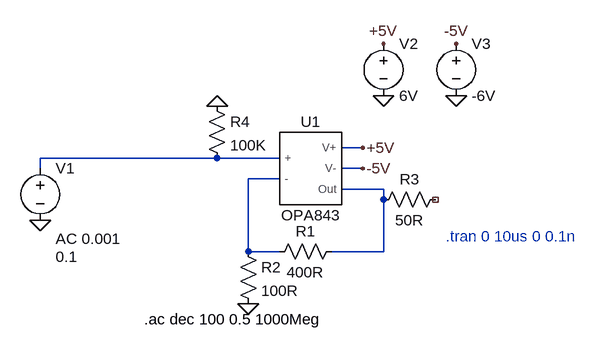
[diagram p0: schematic Draft1.asc]
Draft1.asc, the LTspice schematic file:
Version 4.1
SHEET 1 880 680
WIRE 256 160 224 160
WIRE 32 176 -240 176
WIRE 128 176 32 176
WIRE -240 192 -240 176
WIRE 256 192 224 192
WIRE 128 208 80 208
WIRE 288 224 224 224
WIRE 288 240 288 224
WIRE 80 320 80 208
WIRE 128 320 80 320
WIRE 288 320 288 240
WIRE 288 320 208 320
FLAG 80 400 0
FLAG -240 272 0
FLAG 400 80 0
FLAG 288 80 0
FLAG 288 0 +5V
FLAG 400 0 -5V
FLAG 256 160 +5V
FLAG 256 192 -5V
FLAG 32 96 0
SYMBOL OPA843 176 192 R0
SYMATTR InstName U1
SYMBOL res 224 304 R90
WINDOW 0 0 56 VBottom 2
WINDOW 3 32 56 VTop 2
SYMATTR InstName R1
SYMATTR Value 400R
SYMBOL res 64 304 R0
SYMATTR InstName R2
SYMATTR Value 100R
SYMBOL voltage -240 176 R0
WINDOW 3 24 152 Left 2
WINDOW 123 24 124 Left 2
WINDOW 39 0 0 Left 0
SYMATTR InstName V1
SYMATTR Value 0.1
SYMATTR Value2 AC 0.001
SYMBOL voltage 288 -16 R0
WINDOW 123 0 0 Left 0
WINDOW 39 0 0 Left 0
SYMATTR InstName V2
SYMATTR Value 6V
SYMBOL voltage 400 -16 R0
WINDOW 123 0 0 Left 0
WINDOW 39 0 0 Left 0
SYMATTR InstName V3
SYMATTR Value -6V
SYMBOL res 384 224 R90
WINDOW 0 0 56 VBottom 2
WINDOW 3 32 56 VTop 2
SYMATTR InstName R3
SYMATTR Value 50R
SYMBOL res 16 80 R0
SYMATTR InstName R4
SYMATTR Value 100K
TEXT -80 424 Left 2 !.ac dec 100 0.5 1000Meg
TEXT 384 296 Left 2 ;.tran 0 10us 0 0.1n

The netlist it stands for:
* Draft1.asc
X§U1 N001 N002 +5V -5V N003 OPA843  ; pins + - V+ V- Out
R1 N003 N002 400R
R2 N002 0 100R
V1 N001 0 0.1 AC 0.001
V2 +5V 0 6V
V3 -5V 0 -6V
R3 NC_01 N003 50R
R4 0 N001 100K
.ac dec 100 0.5 1000Meg
* .tran 0 10us 0 0.1n
.lib C:\Projects\JEF2140_Noise_Ampilfer\Simulation\LTspice\OPA843.LIB
.backanno
.end